# Altium schematic sheet ECU_Carrier_Sch.SchDoc
size A1; SheetNumber: 1; SheetTotal: 1; SPICEModelCacheUWHEBAZM: <root> / <DocumentId>UWHEBAZM</DocumentId> / <CacheFrame Number="0"> / <Model Name="led1" Kind="MDL"> / <Text>*Typ RED GaAs LED: Vf=1.7V Vr=4V If=40mA trr=3uS / *LED Pinout: 1=A, 2=K / .MODEL LED1 D (IS=93.2P RS=42M N=3.73 BV=4 IBV=10U / + CJO=2.97P VJ=.75 M=.333 TT=4.32U)</Text> / </Model> / <Model Name="fuse" Kind="CKT"> / <Text>.SUBCKT FUSE 1 2 PARAMS: CURRENT=1 RESISTANCE=1m / SW1 1 2 3 0 SMOD OFF / BNLV 3 0 V=(abs(v(1,2))) / .MODEL SMOD SW (VT={(CURRENT*RESISTANCE)} RON=1g ROFF={RESISTANCE}) / .ENDS FUSE</Text> / </Model> / <Model Name="led2" Kind="MDL"> / <Text>*Typ RED,GREEN,YELLOW,AMBER GaAs LED: Vf=2.1V Vr=4V If=40mA trr=3uS / *LED Pinout: 1=A, 2=K / .MODEL LED2 D (IS=93.1P RS=42M N=4.61 BV=4 IBV=10U / + CJO=2.97P VJ=.75 M=.333 TT=4.32U)</Text> / </Model> / </CacheFrame> / </root>
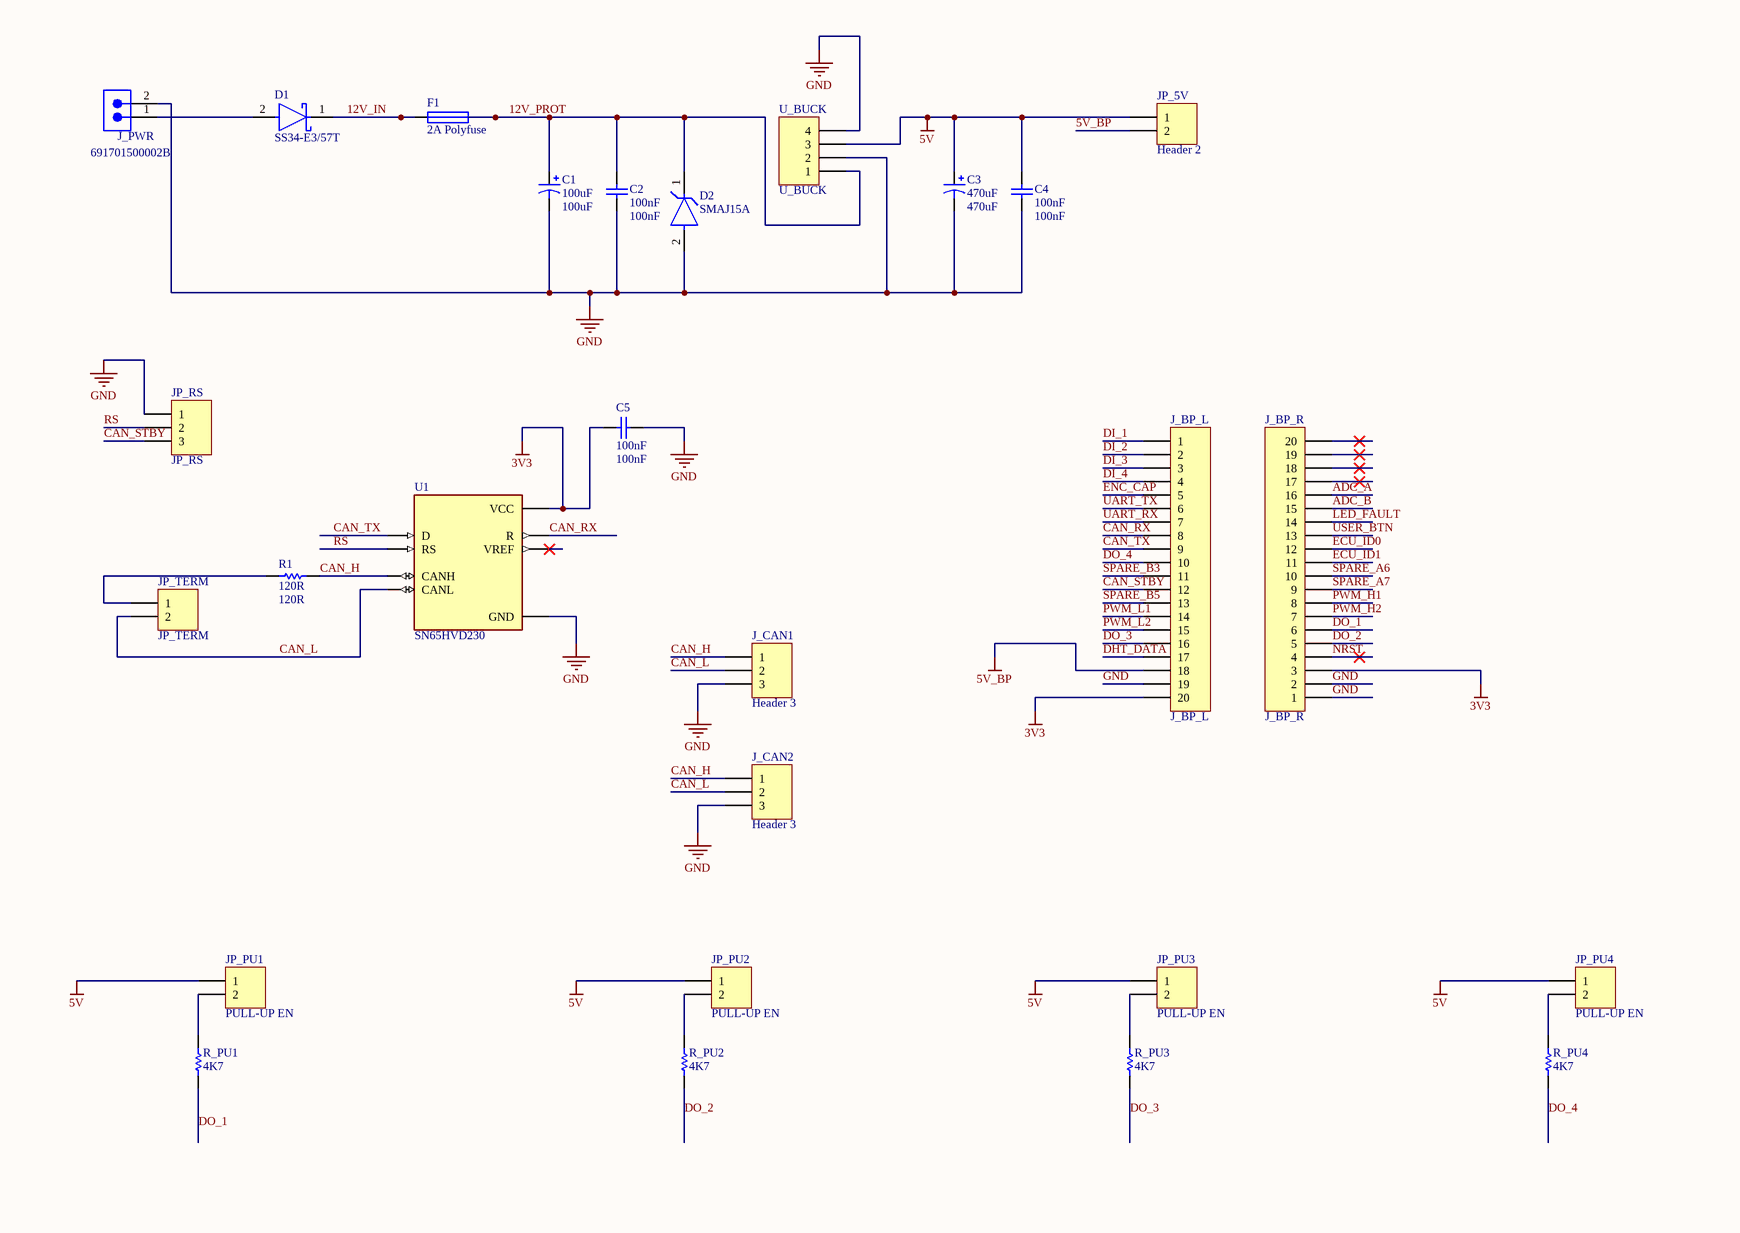
[diagram p0: ECU_Carrier_Sch.SchDoc, top left]
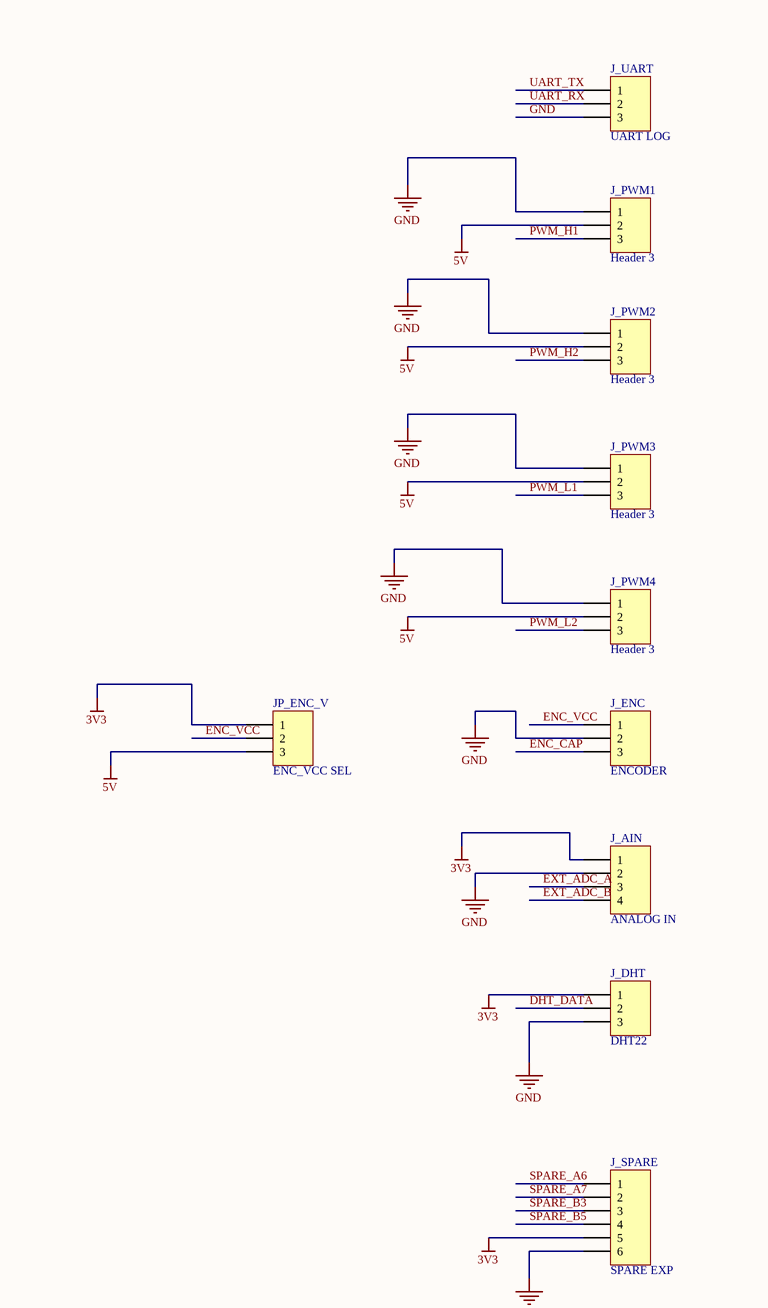
[diagram p1: ECU_Carrier_Sch.SchDoc, top right]
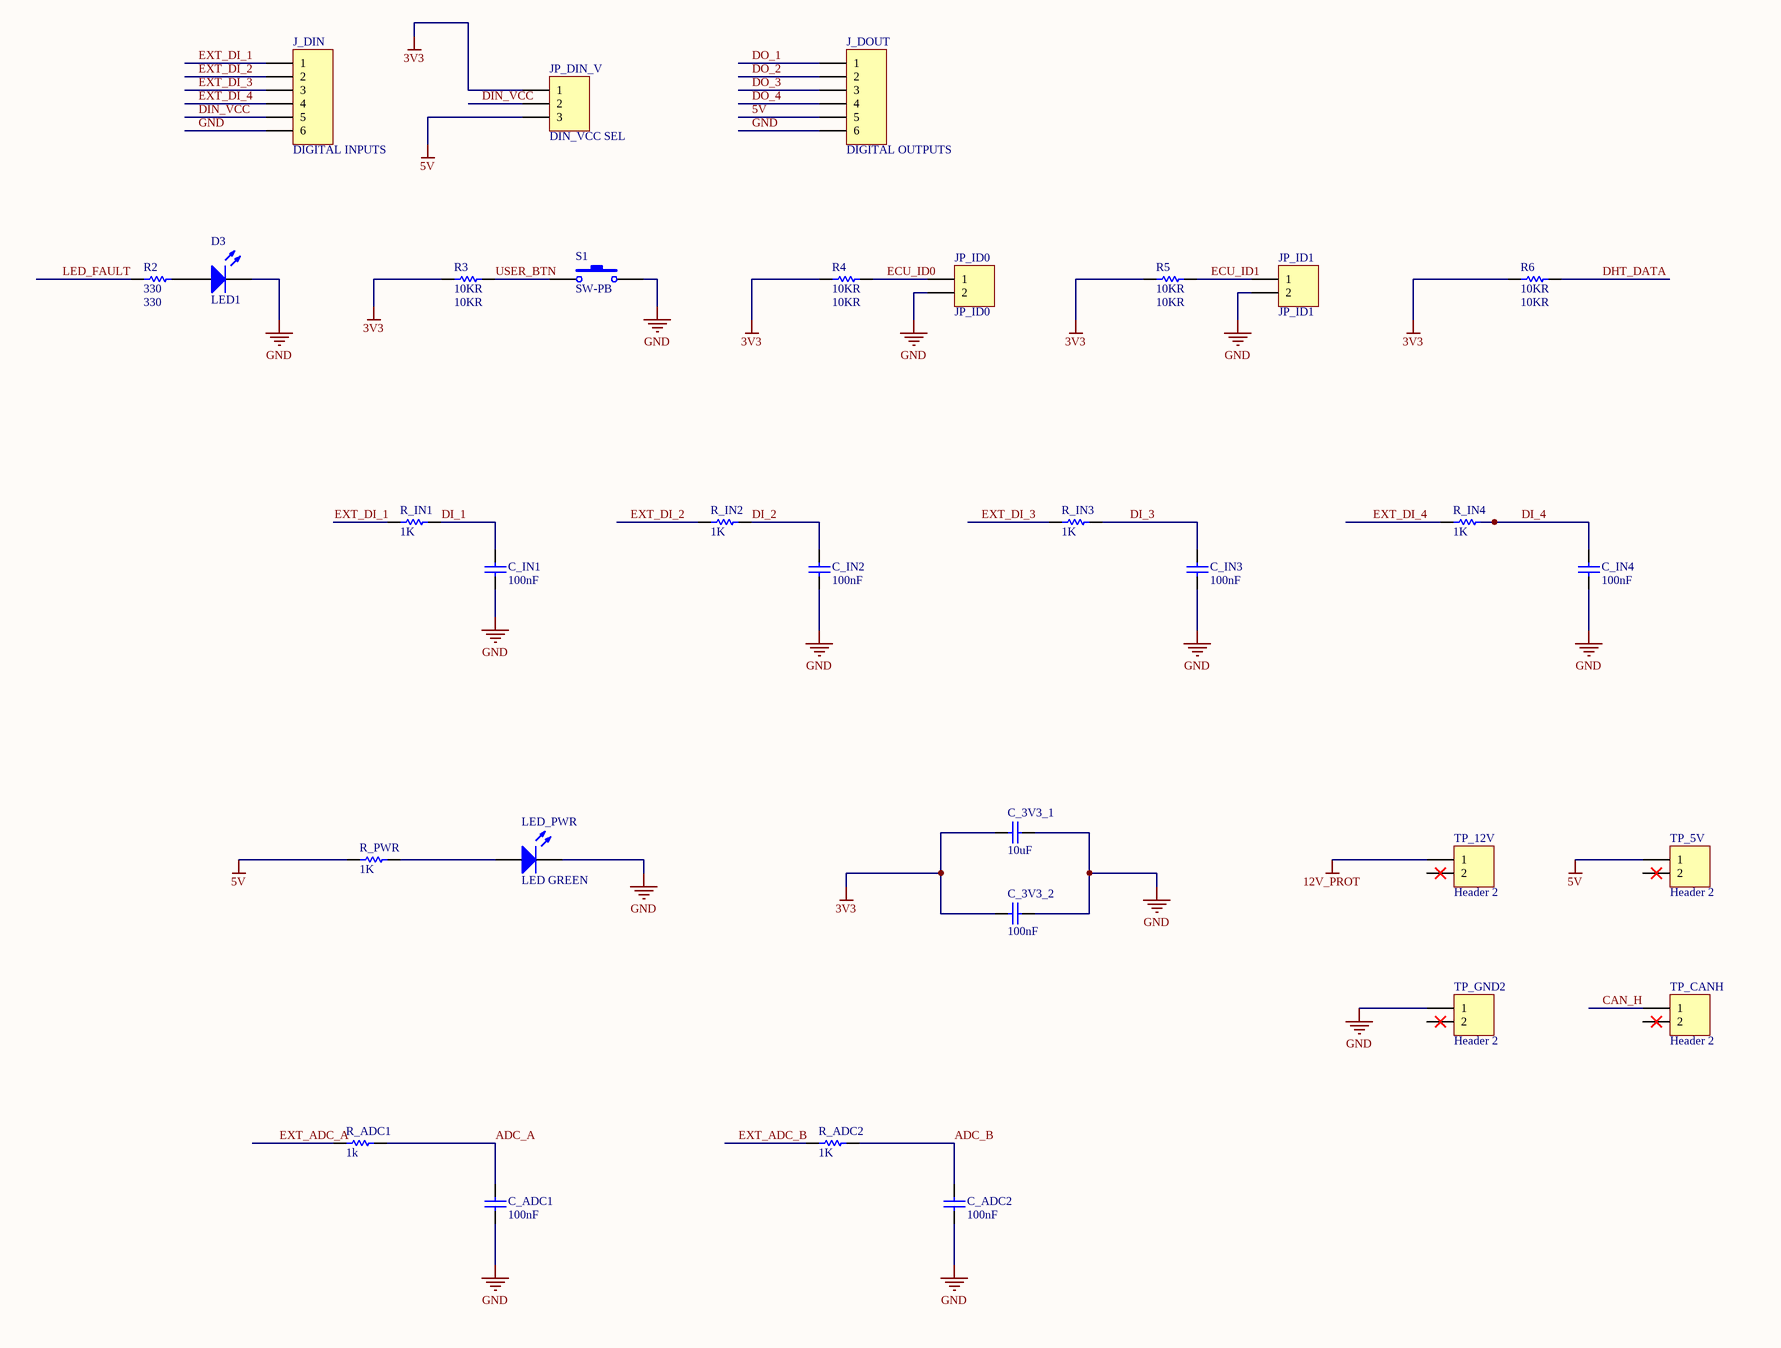
[diagram p2: ECU_Carrier_Sch.SchDoc, bottom left]
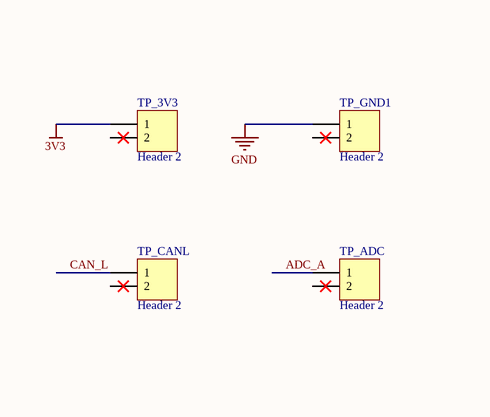
[diagram p3: ECU_Carrier_Sch.SchDoc, bottom right]

## Parts
C1  100uF  [CP_D8_P3.5]
C2  100nF  [C_0805]
C3  470uF  [CP_D8_P3.5]
C4  100nF  [C_0805]
C5  100nF  [C_0805]
C_3V3_1  10uF  [C_0805]
C_3V3_2  100nF  [C_0805]
C_ADC1  100nF  [C_0805]
C_ADC2  100nF  [C_0805]
C_IN1  100nF  [C_0805]
C_IN2  100nF  [C_0805]
C_IN3  100nF  [C_0805]
C_IN4  100nF  [C_0805]
D1  SS34-E3/57T  [FP-95402-MFG]
D2  SMAJ15A  [FP-SMA-MFG]
D3  LED1  [LED_0805]
F1  2A Polyfuse  [FUSE_P5.08]
J_AIN  ANALOG IN  [HDR1X4]
J_BP_L  J_BP_L  [HDR1X20]
J_BP_R  J_BP_R  [HDR1X20]
J_CAN1  Header 3  [HDR1X3]
J_CAN2  Header 3  [HDR1X3]
J_DHT  DHT22  [HDR1X3]
J_DIN  DIGITAL INPUTS  [HDR1X6]
J_DOUT  DIGITAL OUTPUTS  [HDR1X6]
J_ENC  ENCODER  [HDR1X3]
J_PWM1  Header 3  [HDR1X3]
J_PWM2  Header 3  [HDR1X3]
J_PWM3  Header 3  [HDR1X3]
J_PWM4  Header 3  [HDR1X3]
J_PWR  691701500002B  [691701500002B]
J_SPARE  SPARE EXP  [HDR1X6]
J_UART  UART LOG  [HDR1X3]
JP_5V  Header 2  [HDR1X2]
JP_DIN_V  DIN_VCC SEL  [HDR1X3]
JP_ENC_V  ENC_VCC SEL  [HDR1X3]
JP_ID0  JP_ID0  [HDR1X2]
JP_ID1  JP_ID1  [HDR1X2]
JP_PU1  PULL-UP EN  [HDR1X2]
JP_PU2  PULL-UP EN  [HDR1X2]
JP_PU3  PULL-UP EN  [HDR1X2]
JP_PU4  PULL-UP EN  [HDR1X2]
JP_RS  JP_RS  [HDR1X3]
JP_TERM  JP_TERM  [HDR1X2]
LED_PWR  LED GREEN  [LED_0805]
R1  120R  [R_0805]
R2  330  [R_0805]
R3  10KR  [R_0805]
R4  10KR  [R_0805]
R5  10KR  [R_0805]
R6  10KR  [R_0805]
R_ADC1  1k  [R_0805]
R_ADC2  1K  [R_0805]
R_IN1  1K  [R_0805]
R_IN2  1K  [R_0805]
R_IN3  1K  [R_0805]
R_IN4  1K  [R_0805]
R_PU1  4K7  [R_0805]
R_PU2  4K7  [R_0805]
R_PU3  4K7  [R_0805]
R_PU4  4K7  [R_0805]
R_PWR  1K  [R_0805]
S1  SW-PB  [SW_TACT_6x6]
TP_3V3  Header 2  [HDR1X2]
TP_5V  Header 2  [HDR1X2]
TP_12V  Header 2  [HDR1X2]
TP_ADC  Header 2  [HDR1X2]
TP_CANH  Header 2  [HDR1X2]
TP_CANL  Header 2  [HDR1X2]
TP_GND1  Header 2  [HDR1X2]
TP_GND2  Header 2  [HDR1X2]
U1  SN65HVD230  [SOIC127P599X175-8N]
U_BUCK  U_BUCK  [HDR1X4]

## Nets
3V3: C5.2 C_3V3_1.1 C_3V3_2.1 J_AIN.1 J_BP_L.20 J_BP_R.3 J_DHT.1 J_SPARE.5 JP_DIN_V.1 JP_ENC_V.1 R3.1 R4.1 R5.1 R6.1 TP_3V3.1 U1.3(VCC)
5V: C3.1 C4.2 J_DOUT.5 J_PWM1.2 J_PWM2.2 J_PWM3.2 J_PWM4.2 JP_5V.1 JP_DIN_V.3 JP_ENC_V.3 JP_PU1.1 JP_PU2.1 JP_PU3.1 JP_PU4.1 R_PWR.1 TP_5V.1 U_BUCK.3
5V_BP: J_BP_L.18 JP_5V.2
12V_PROT: C1.1 C2.2 D2.1(C) F1.2 TP_12V.1 U_BUCK.1
GND: C1.2 C2.1 C3.2 C4.1 C5.1 C_3V3_1.2 C_3V3_2.2 C_ADC1.1 C_ADC2.1 C_IN1.1 C_IN2.1 C_IN3.1 C_IN4.1 D2.2(A) D3.2(K) J_AIN.2 J_BP_L.19 J_BP_R.1 J_BP_R.2 J_CAN1.3 J_CAN2.3 J_DHT.3 J_DIN.6 J_DOUT.6 J_ENC.2 J_PWM1.1 J_PWM2.1 J_PWM3.1 J_PWM4.1 J_PWR.2 J_SPARE.6 J_UART.3 JP_ID0.2 JP_ID1.2 JP_RS.1 LED_PWR.2(K) S1.2 TP_GND1.1 TP_GND2.1 U1.2(GND) U_BUCK.2 U_BUCK.4
12V_IN: D1.1(C) F1.1
ADC_A: C_ADC1.2 J_BP_R.16 R_ADC1.2 TP_ADC.1
ADC_B: C_ADC2.2 J_BP_R.15 R_ADC2.2
CAN_H: J_CAN1.1 J_CAN2.1 R1.2 TP_CANH.1 U1.7(CANH)
CAN_L: J_CAN1.2 J_CAN2.2 JP_TERM.2 TP_CANL.1 U1.6(CANL)
CAN_RX: J_BP_L.8 U1.4(R)
CAN_STBY: J_BP_L.12 JP_RS.3
CAN_TX: J_BP_L.9 U1.1(D)
DHT_DATA: J_BP_L.17 J_DHT.2 R6.2
DI_1: C_IN1.2 J_BP_L.1 R_IN1.2
DI_2: C_IN2.2 J_BP_L.2 R_IN2.2
DI_3: C_IN3.2 J_BP_L.3 R_IN3.2
DI_4: C_IN4.2 J_BP_L.4 R_IN4.2
DIN_VCC: J_DIN.5 JP_DIN_V.2
DO_1: J_BP_R.6 J_DOUT.1 R_PU1.1
DO_2: J_BP_R.5 J_DOUT.2 R_PU2.1
DO_3: J_BP_L.16 J_DOUT.3 R_PU3.1
DO_4: J_BP_L.10 J_DOUT.4 R_PU4.1
ECU_ID0: J_BP_R.12 JP_ID0.1 R4.2
ECU_ID1: J_BP_R.11 JP_ID1.1 R5.2
ENC_CAP: J_BP_L.5 J_ENC.3
ENC_VCC: J_ENC.1 JP_ENC_V.2
EXT_ADC_A: J_AIN.3 R_ADC1.1
EXT_ADC_B: J_AIN.4 R_ADC2.1
EXT_DI_1: J_DIN.1 R_IN1.1
EXT_DI_2: J_DIN.2 R_IN2.1
EXT_DI_3: J_DIN.3 R_IN3.1
EXT_DI_4: J_DIN.4 R_IN4.1
LED_FAULT: J_BP_R.14 R2.1
NRST: J_BP_R.4
PWM_H1: J_BP_R.8 J_PWM1.3
PWM_H2: J_BP_R.7 J_PWM2.3
PWM_L1: J_BP_L.14 J_PWM3.3
PWM_L2: J_BP_L.15 J_PWM4.3
RS: JP_RS.2 U1.8(RS)
SPARE_A6: J_BP_R.10 J_SPARE.1
SPARE_A7: J_BP_R.9 J_SPARE.2
SPARE_B3: J_BP_L.11 J_SPARE.3
SPARE_B5: J_BP_L.13 J_SPARE.4
UART_RX: J_BP_L.7 J_UART.2
UART_TX: J_BP_L.6 J_UART.1
USER_BTN: J_BP_R.13 R3.2 S1.1
NetD1_2: D1.2(A) J_PWR.1
NetD3_1: D3.1(A) R2.2
NetJP_PU1_2: JP_PU1.2 R_PU1.2
NetJP_PU2_2: JP_PU2.2 R_PU2.2
NetJP_PU3_2: JP_PU3.2 R_PU3.2
NetJP_PU4_2: JP_PU4.2 R_PU4.2
NetJP_TERM_1: JP_TERM.1 R1.1
NetLED_PWR_1: LED_PWR.1(A) R_PWR.2

Not connected (* = marked no-connect by the designer): J_BP_R 17* 18* 19* 20*; TP_3V3 2; TP_5V 2; TP_12V 2; TP_ADC 2; TP_CANH 2; TP_CANL 2; TP_GND1 2; TP_GND2 2; U1 5(VREF)*

## Library data of the parts
C1 C3 = Cap Pol1: Polarized Capacitor (Radial); Published: 8-Jun-2000; LatestRevisionDate: 17-Jul-2002; LatestRevisionNote: Re-released for DXP Platform.; PackageReference: RB7.6-15; Publisher: Altium Limited; PackageDescription: Polarized Capacitor (Radial); 2 Leads
  C1: Value: 100uF
  C3: Value: 470uF
C2 C4 C5 C_3V3_1 C_3V3_2 C_ADC1 C_ADC2 C_IN1-C_IN3 = Cap: Capacitor; Published: 8-Jun-2000; LatestRevisionDate: 17-Jul-2002; LatestRevisionNote: Re-released for DXP Platform.; PackageReference: RAD-0.3; Publisher: Altium Limited; PackageDescription: Radial Cap, Thru-Hole; 2 Leads; 0.3 in Pin Spacing
  C2 C4 C5 C_3V3_2 C_ADC1 C_ADC2 C_IN1-C_IN3: Value: 100nF
  C_3V3_1: Value: 10uF
C_IN4 = Cap: Published: 8-Jun-2000; LatestRevisionDate: 17-Jul-2002; LatestRevisionNote: Re-released for DXP Platform.; PackageReference: RAD-0.3; Publisher: Altium Limited; PackageDescription: Radial Cap, Thru-Hole; 2 Leads; 0.3 in Pin Spacing; Value: 100nF
D1 = CMP-02539-000012-1: DIODE SCHOTTKY 40V 3A DO214AB; Manufacturer: Vishay; Max Junction Temp: +150°C; Peak Reverse Current: 0.5mA; Max Surge Forward Current: 100A; Standoff Height: 0mm; ComponentLink2Description: Datasheet; Device Class L3: Schottky Diodes; Height: 2.62mm; Max Repetitive Reverse Voltage: 40V; Lead Free: Yes; Package: 95402; Temperature Range High: +150°C; ComponentLink2URL: http://www.vishay.com/docs/88751/ss32.pdf; Temperature: -55°C to +150°C; Footprint Url: http://www.vishay.com/docs/95402/smc.pdf; Automotive: No; Forward Current: 3A; Category: Diode; Manufacturer Part Number: SS34-E3/57T; RoHS: TRUE; Device Class L2: Diodes; Mouser Description: Schottky Diodes & Rectifiers 3.0 Amp 40 Volt; Octopart: https://octopart.com/ss34-e3%2F57t-vishay-39552907; Temperature Range Low: -55°C; Device Class L1: Discrete Semiconductors; Digikey Description: DIODE SCHOTTKY 40V 3A DO214AB
D2 = CMP-07401-000026-1: TVS DIODE 15V 24.4V SMA; Manufacturer: Bourns Inc.; Max Junction Temp: +150°C; Peak Pulse Current: 16.4A; Direction: Unidirectional; Breakdown Voltage: 16.7V; Number Of Channels: 1; Peak Pulse Power: 400W; Mouser Description: Bourns Smaj15a / Diode Tvs 15v 400w Uni 5% Smd Bourns; Temperature Range Low: -55°C; ComponentLink2Description: Datasheet; Package: SMA; Reverse Standoff Voltage: 15V; Category: Diode; Device Class L2: TVS Diodes; Lead Free: Yes; RoHS: TRUE; Clamping Voltage: 24.4V; ComponentLink2URL: https://www.bourns.com/docs/Product-Datasheets/SMAJ.pdf; Digikey Description: TVS DIODE 15V 24.4V SMA; Temperature Range High: +150°C; Height: 2.29mm; Device Class L1: Circuit Protection; Device Class L3: unset; Temperature: -55°C to +150°C; Octopart: https://octopart.com/smaj15a-bourns-12809353; Manufacturer Part Number: SMAJ15A; Automotive: No
D3 = LED1: Typical RED GaAs LED; Published: 8-Jun-2000; LatestRevisionDate: 08-Jul-2005; LatestRevisionNote: Mech Layer 1 removed.; PackageReference: LED-1; Publisher: Altium Limited; PackageDescription: LED; 2 Leads
F1 = Fuse 1: Fuse; Published: 8-Jun-2000; LatestRevisionDate: 17-Jul-2002; LatestRevisionNote: Re-released for DXP Platform.; PackageReference: PIN-W2/E2.8; Publisher: Altium Limited; PackageDescription: Thru-Hole; 2 Leads
J_AIN U_BUCK = Header 4: Header, 4-Pin; LatestRevisionDate: 17-Jul-2002; LatestRevisionNote: Re-released for DXP Platform.; Publisher: Altium Limited
J_BP_L J_BP_R = Header 20: Header, 20-Pin; LatestRevisionDate: 17-Jul-2002; LatestRevisionNote: Re-released for DXP Platform.; Publisher: Altium Limited
J_CAN1 J_CAN2 J_DHT J_ENC J_PWM1-J_PWM4 J_UART JP_DIN_V JP_ENC_V JP_RS = Header 3: Header, 3-Pin; LatestRevisionDate: 17-Jul-2002; LatestRevisionNote: Re-released for DXP Platform.; Publisher: Altium Limited
J_DIN J_DOUT J_SPARE = Header 6: Header, 6-Pin; LatestRevisionDate: 17-Jul-2002; LatestRevisionNote: Re-released for DXP Platform.; Publisher: Altium Limited
J_PWR = CMP-1502-02318-3: Terminal Block, 5.08MM, Open Vertical Pcb Header, Thr Type, 2 Pins; Gender: Male; Number of Contacts: 2; Current Rating: 10A; Voltage Rating: 300V; Mount: Through Hole; Max Operating Temperature: 105°C; Contact Gender: Male; REACH SVHC: Unknown; Color: Black; Number of Pins: 2; RoHS: Compliant; Contact Material: Brass; Length: 9.76mm; Min Operating Temperature: -40°C; Housing Material: Polymer; Pitch: 5.08mm; Connector Type: Terminal Block; Contact Plating: Tin; Lead Pitch: 5.08mm; Termination: PCB
JP_5V JP_ID0 JP_ID1 JP_PU1-JP_PU4 JP_TERM TP_3V3 TP_5V TP_12V TP_ADC TP_CANH TP_CANL TP_GND1 TP_GND2 = Header 2: Header, 2-Pin; LatestRevisionDate: 17-Jul-2002; LatestRevisionNote: Re-released for DXP Platform.; Publisher: Altium Limited
LED_PWR = LED2: Typical RED, GREEN, YELLOW, AMBER GaAs LED; Published: 8-Jun-2000; LatestRevisionDate: 17-Jul-2002; LatestRevisionNote: Re-released for DXP Platform.; PackageVersion: Feb-2002; PackageReference: 3.2X1.6X1.1; Publisher: Altium Limited; PackageDescription: SM LED; 2 Flat Leads
R1-R6 R_ADC1 R_ADC2 R_IN1-R_IN4 R_PU1-R_PU4 R_PWR = Res1: Resistor; Published: 8-Jun-2000; LatestRevisionDate: 17-Jul-2002; LatestRevisionNote: Re-released for DXP Platform.; PackageReference: AXIAL-0.3; Publisher: Altium Limited; PackageDescription: Axial Device, Thru-Hole; 2 Leads; 0.3 in Pin Spacing
  R1: Value: 120R
  R2: Value: 330
  R3-R6: Value: 10KR
  R_ADC1: Value: 1k
  R_ADC2 R_IN1-R_IN4 R_PWR: Value: 1K
  R_PU1-R_PU4: Value: 4K7
S1 = SW-PB: Switch; Published: 24-Mar-1999; LatestRevisionDate: 17-Jul-2002; LatestRevisionNote: Re-released for DXP Platform.; PackageReference: SPST-2; Publisher: Altium Limited; PackageDescription: Switch; 2 Leads
U1 = SN65HVD230: 1/1 Transceiver Half CANbus 8-SOIC; MF: Texas Instruments; SnapEDA_Link: https://www.snapeda.com/parts/SN65HVD230/Texas+Instruments/view-part/?ref=snap; Package: SOIC-8 Texas Instruments; Value: *; MP: SN65HVD230; Check_prices: https://www.snapeda.com/parts/SN65HVD230/Texas+Instruments/view-part/?ref=eda